# Altium schematic sheet Main.SchDoc
size B; SheetNumber: 1; SheetTotal: 1
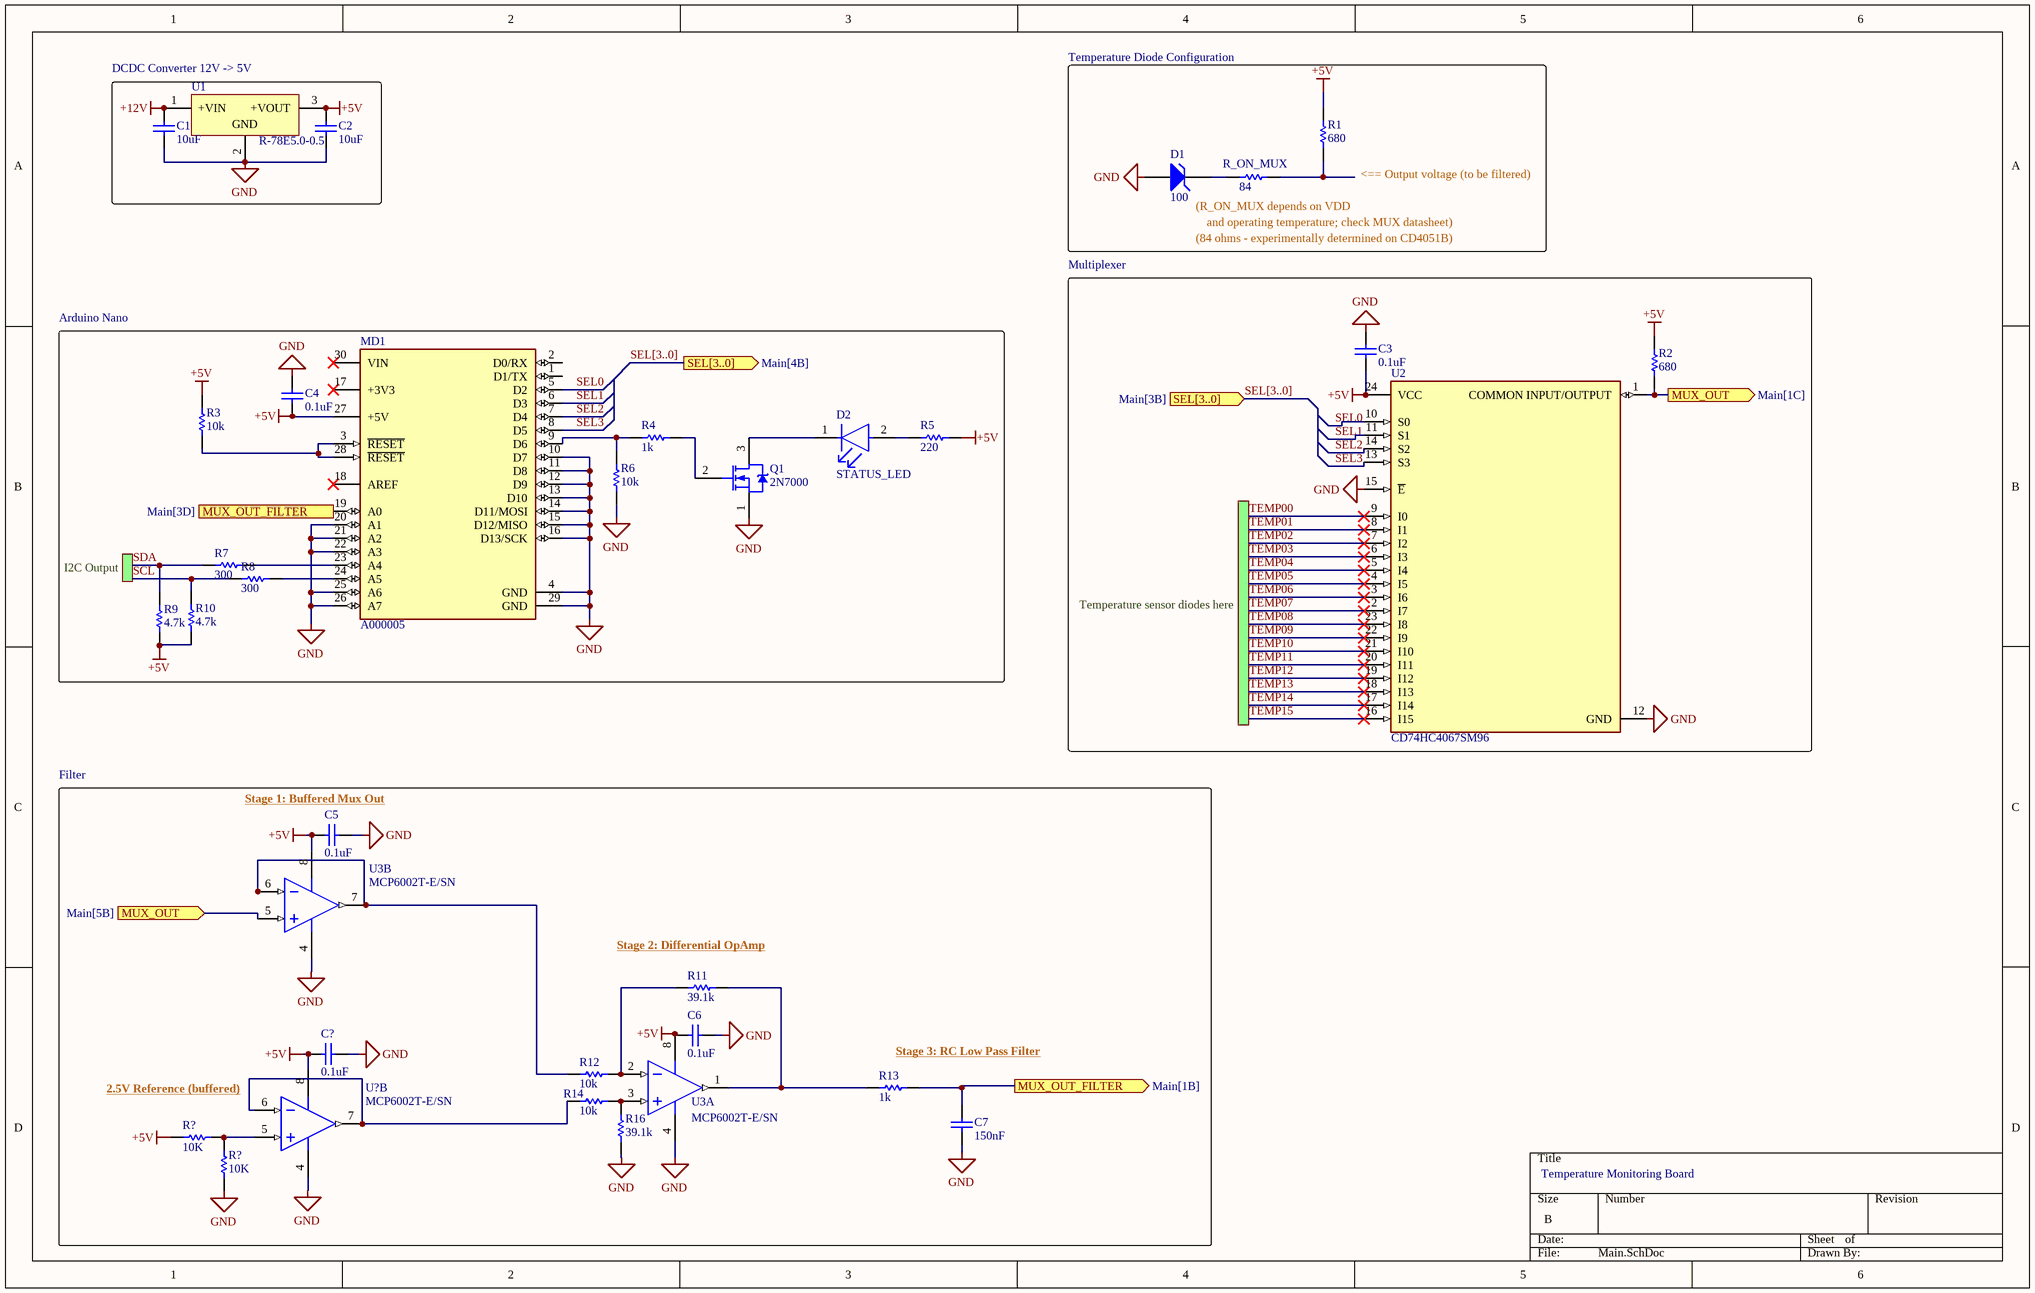
[diagram p0: Main.SchDoc]

## Parts
(Parts that share a designator on the sheet are numbered #1, #2 ... from top to bottom, then left to right.)
C1  value 10uF  (hidden comment: Capacitor)
C2  value 10uF  (hidden comment: Capacitor)
C3  value 0.1uF  (hidden comment: Capacitor)
C4  value 0.1uF  (hidden comment: Capacitor)
C5  value 0.1uF  (hidden comment: Capacitor)
C6  value 0.1uF  (hidden comment: Capacitor)
C7  value 150nF  (hidden comment: Capacitor)
C?  value 0.1uF  (hidden comment: Capacitor)
D1  BV: 100  (hidden comment: Zener Diode)
D2  STATUS_LED  [FP-LTL-1CHEE-MFG]
MD1  A000005  [FP-A000005-MFG]
Q1  2N7000  [ONSC-TO-92-3-29-11]
R1  value 680  (hidden comment: Resistor)
R2  value 680  (hidden comment: Resistor)
R3  value 10k  (hidden comment: Resistor)
R4  value 1k  (hidden comment: Resistor)
R5  value 220  (hidden comment: Resistor)
R6  value 10k  (hidden comment: Resistor)
R7  value 300  (hidden comment: Resistor)
R8  value 300  (hidden comment: Resistor)
R9  value 4.7k  (hidden comment: Resistor)
R10  value 4.7k  (hidden comment: Resistor)
R11  value 39.1k  (hidden comment: Resistor)
R12  value 10k  (hidden comment: Resistor)
R13  value 1k  (hidden comment: Resistor)
R14  value 10k  (hidden comment: Resistor)
R16  value 39.1k  (hidden comment: Resistor)
R?#1  value 10K  (hidden comment: Resistor)
R?#2  value 10K  (hidden comment: Resistor)
R_ON_MUX  value 84  (hidden comment: Resistor)
U1  R-78E5.0-0.5  [REPO-R-78E-0.5-3_V]
U2  CD74HC4067SM96  [FP-DB0024A-IPC_C]
U3  MCP6002T-E/SN  [SOIC-SN8_N]  (parts A,B of 2)
U?  MCP6002T-E/SN  [SOIC-SN8_N]  (part B of 2)

## Blocks framed on the sheet
DCDC Converter 12V -> 5V: C1 C2 U1

## Ports
MUX_OUT (in, see Main[5B]), MUX_OUT (out, see Main[1C]), MUX_OUT_FILTER (in, see Main[3D]), MUX_OUT_FILTER (out, see Main[1B]), SEL[3..0] (in, see Main[3B]), SEL[3..0] (out, see Main[4B])

## Nets
+5V: C2.2 C3.1 C4.1 C5.1 C6.1 C?.1 MD1.27(+5V) R1.2 R2.2 R3.1 R5.1 R9.2 R10.2 R?#1.1 U1.3(+VOUT) U2.24(VCC) U3.8(VDD) U?.8(VDD)
+12V: C1.2 U1.1(+VIN)
GND: C1.1 C2.1 C3.2 C4.2 C5.2 C6.2 C7.1 C?.2 D1.1(A) MD1.4(GND) MD1.10(D7) MD1.11(D8) MD1.12(D9) MD1.13(D10) MD1.14(D11/MOSI) MD1.15(D12/MISO) MD1.16(D13/SCK) MD1.20(A1) MD1.21(A2) MD1.22(A3) MD1.25(A6) MD1.26(A7) MD1.29(GND) Q1.1(S) R6.2 R16.1 R?#2.1 U1.2(GND) U2.12(GND) U2.15(~{E}) U3.4(VSS)
MUX_OUT: R2.1 U2.1(COMMON_INPUT/OUTPUT) U3.5(VINB+) ; port MUX_OUT
MUX_OUT_FILTER: C7.2 MD1.19(A0) R13.2 ; port MUX_OUT_FILTER
SCL: R8.1 R10.1
SDA: R7.1 R9.1
SEL0: MD1.5(D2) U2.10(S0)
SEL1: MD1.6(D3) U2.11(S1)
SEL2: MD1.7(D4) U2.14(S2)
SEL3: MD1.8(D5) U2.13(S3)
TEMP00: U2.9(I0)
TEMP01: U2.8(I1)
TEMP02: U2.7(I2)
TEMP03: U2.6(I3)
TEMP04: U2.5(I4)
TEMP05: U2.4(I5)
TEMP06: U2.3(I6)
TEMP07: U2.2(I7)
TEMP08: U2.23(I8)
TEMP09: U2.22(I9)
TEMP10: U2.21(I10)
TEMP11: U2.20(I11)
TEMP12: U2.19(I12)
TEMP13: U2.18(I13)
TEMP14: U2.17(I14)
TEMP15: U2.16(I15)
NetD1_2: D1.2(K) R_ON_MUX.2
NetD2_1: D2.1(C) Q1.3(D)
NetD2_2: D2.2(A) R5.2
NetMD1_3: MD1.3(~{RESET}) MD1.28(~{RESET}) R3.2
NetMD1_9: MD1.9(D6) R4.2 R6.1
NetMD1_23: MD1.23(A4) R7.2
NetMD1_24: MD1.24(A5) R8.2
NetQ1_2: Q1.2(G) R4.1
NetR1_1: R1.1 R_ON_MUX.1
NetR11_1: R11.1 R12.2 U3.2(VINA-)
NetR11_2: R11.2 R13.1 U3.1(VOUTA)
NetR12_1: R12.1 U3.6(VINB-) U3.7(VOUTB)
NetR14_1: R14.1 U?.6(VINB-) U?.7(VOUTB)
NetR14_2: R14.2 R16.2 U3.3(VINA+)
NetR?#1_2: R?#1.2 R?#2.2 U?.5(VINB+)

Not connected (* = marked no-connect by the designer): MD1 1(D1/TX) 2(D0/RX) 17(+3V3)* 18(AREF)* 30(VIN)*; U? 4(VSS)

## Buses and harness runs
bus SEL[3..0] = port SEL[3..0]

## Notes on the sheet
- Temperature Diode Configuration
- (R_ON_MUX depends on VDD
- and operating temperature; check MUX datasheet)
- (near R1) <== Output voltage (to be filtered)
- Multiplexer
- (84 ohms - experimentally determined on CD4051B)
- Arduino Nano
- (near R9) I2C Output
- Temperature sensor diodes here
- Filter
- (near C5) Stage 1: Buffered Mux Out
- (near R11) Stage 2: Differential OpAmp
- (near U?) 2.5V Reference (buffered)
- (near R13) Stage 3: RC Low Pass Filter
- Temperature Monitoring Board
- Labels drawn without touching a wire or pin: GND

## Library data of the parts
C1-C7 C? = Capacitor: SimulationGenericComponent: True
D1 = Zener Diode: AF: 1; BV_MAX: 1e99; CJO: 0; EG: 1.11; FC: 0.5; IBV: 0.001; IS: 1e-14; MJSW: 0.33; NTUN: 30; TNOM: 27; XTI: 3; SimulationGenericComponent: True; CJP: 0; CTA: 0; CTP: 0; FCS: 0.5; FV_MAX: 1e99; IKF: 0; IKR: 0; ISR: 1e-14; JSW: 0; JTUN: 0; JTUNSW: 0; KEG: 1; KF: 0; LEVEL: 1; N: 1; NBV: 1; NR: 1; NS: 1; PHP: 1; RS: 0; TCV: 0; TLEV: 0; TLEVC: 0; TM1: 0; TM2: 0; TPB: 0; TPHP: 0; TRS: 0; TRS2: 0; TT: 0; TTT1: 0; TTT2: 0; VJ: 1; XTITUN: 3
D2 = CMP-22017-000040-1: LED RED CLEAR T/H; Viewing Angle: 45°; Power Dissipation: 100mW; Wavelength: 635nm; Number of LEDs: 1; Test Current: 10mA; Lens Style: Dome; Forward Current: 30mA; Forward Voltage: 2V; Luminous Intensity: 19mcd; Reverse Voltage: 5V; Dominant Wavelength: 625nm; RoHS Compliant: Yes; Mount: Through Hole; Diameter: 3.1mm; Package Quantity: 1000; Lens Transparency: Clear; Illumination Color: Red; Lens Color: Red; Max Operating Temperature: 100°C; Radiation Hardening: No; Case/Package: T; Width: 3.8mm; Length: 3.8mm; Depth: 3.8mm; Series: -; Number of Pins: 2; Number of Elements: 1; Height: 5.2mm; Max Power Dissipation: 100mW; Lead Free: Lead Free; Packaging: Bulk; Color: Red; Min Operating Temperature: -55°C
MD1 = CMP-189986-000002-1: ARDUINO NANO ATMEGA328 EVAL BRD; Number of Bits: 8; Evaluation Kit: Yes; Operating Supply Voltage: 12V; Interface: I2C; Data Bus Width: 8b; Core Architecture: AVR; Packaging: Bulk; Length: 7inch; Package Quantity: 50; Width: 5inch; REACH SVHC: No SVHC; Weight: 0.358383oz; Series: AVR® ATmega; Height: 0.25inch
Q1 = CMP-1058-00936-1: Small Signal MOSFET, 200 mA, 60 V, N-Channel, 3-Pin TO-92, Bulk Box; Manufacturer: On Semiconductor; Ciss Typ (pF): 60; VGS(th) Max (V): 3; Crss Typ (pF): 5; Channel Polarity: N Channel; VGS Max (V): 20; Configuration: Single; PD Max (W): 0.35; Coss Typ (pF): 25; ID Max (A): 0.2; PackageVersion: Rev. AM; ComponentLink3URL: http://www.onsemi.cn/pub_link/Collateral/2N6426-D.PDF; ComponentLink2URL: http://www.onsemi.com/pub_link/Collateral/2N7000-D.PDF; DatasheetVersion: Rev. 8; Mounting Technology: Through Hole; V(BR)DSS Min (V): 60; PartNumber: 2N7000; PackageDescription: 3-Pin Transistor Outline, Body 4.825 x 3.685 mm, Pitch 1.27 mm; ComponentLink2Description: Datasheet; ComponentLink1URL: http://www.onsemi.com/; PackageReference: TO-92-3-29-11_AM_SL; Packing: Bulk Box; ComponentLink1Description: Manufacturer URL; Package Type: TO-92; ComponentLink3Description: Package Specification
R1-R14 R16 R?#1 R?#2 R_ON_MUX = Resistor: TC1: 0; SimulationGenericComponent: True; TC2: 0
U1 = CMP-2000-06922-2: DC/DC-Converter, 5 V Single Output, 500 mA, -40 to 85 degC, 3-Pin THD, RoHS, Tube; Manufacturer: Recom Power; Efficiency: 92%; Number of Outputs: 1; Current - Output (Max): 500mA; VIN Min: 7V; Package Version: Rev. 0; VIN Max: 28V; VOUT: 5V; Manufacturer URL: http://www.recom-power.com/us/americas/home.html; Operating Temperature: -40°C~85°C; Datasheet Version: 01/2017; Packaging: Tube; Package Reference: SIP Module; Datasheet URL: http://www.recom-power.com/pdf/Innoline/R-78Exx-0.5.pdf; Package Description: 3-Pin Through Hole Device, Body 11.6 x 8.5 mm, Pitch 2.54 mm; Mounting Technology: ThroughHole
U2 = CMP-04892-000038-1: IC MUX/DEMUX 1X16 24SSOP; Supply Type: Single; High Level Output Current: 25mA; Min Supply Voltage: 2V; Number of Circuits: 16; Max Supply Voltage: 6V; Number of Channels: 1; Turn-On Delay Time: 300ns; Max Supply Current: 8uA; Bandwidth: 89MHz; Turn-Off Delay Time: 290ns; Propagation Delay: 75ns; Logic Function: Multiplexer; On-State Resistance: 160R; Polarity: Non-Inverting; Width: 5.3mm; Case/Package: SSOP; Max Operating Temperature: 125°C; Mount: Surface Mount; Min Operating Temperature: -55°C; REACH SVHC: No SVHC; Contact Plating: Gold; Max Output Current: 25mA; Weight: 0.006081oz; Height: 1.95mm; Package Quantity: 2000; Length: 8.2mm; Lead Free: Lead Free; Operating Supply Current: 8uA; Packaging: Tape and Reel; Series: 74HC; Low Level Output Current: 25mA; Number of Outputs: 1; Termination: SMD/SMT; Number of Inputs: 16; Number of Bits: 16; Radiation Hardening: No; Number of Pins: 24
U3 U? = CMP-0187-00363-3: None; Nominal Supply Current: 100uA; Operating Supply Voltage: 5.5V; Input Bias Current: 1pA; Output Current per Channel: 23mA; Unity Gain Bandwidth Product: 1MHz; Number of Elements: 2; Power Supply Rejection Ratio (PSRR): 86dB; Slew Rate: 0.6V/µs; Min Supply Voltage: 1.8V; Voltage Gain: 112dB; Max Supply Voltage: 6V; Input Offset Voltage (Vos): 4.5mV; Common Mode Rejection Ratio: 60dB; Amplifier Type: GENERAL PURPOSE; Technology: CMOS; Output Current: 23mA; Number of Pins: 8; Lead Free: Lead Free; Number of Channels: 2; Package Quantity: 3300; Max Operating Temperature: 125°C; Number of Circuits: 2; Supply Current: 100uA; Gain Bandwidth Product: 1MHz; Min Operating Temperature: -40°C; Series: -; Mount: Surface Mount; Case/Package: SOIC; Radiation Hardening: No; Packaging: Tape and Reel; Operating Supply Current: 100uA; RoHS Compliant: Yes